# Altium schematic sheet Connections.SchDoc
size A; SheetNumber: 1; SheetTotal: 4
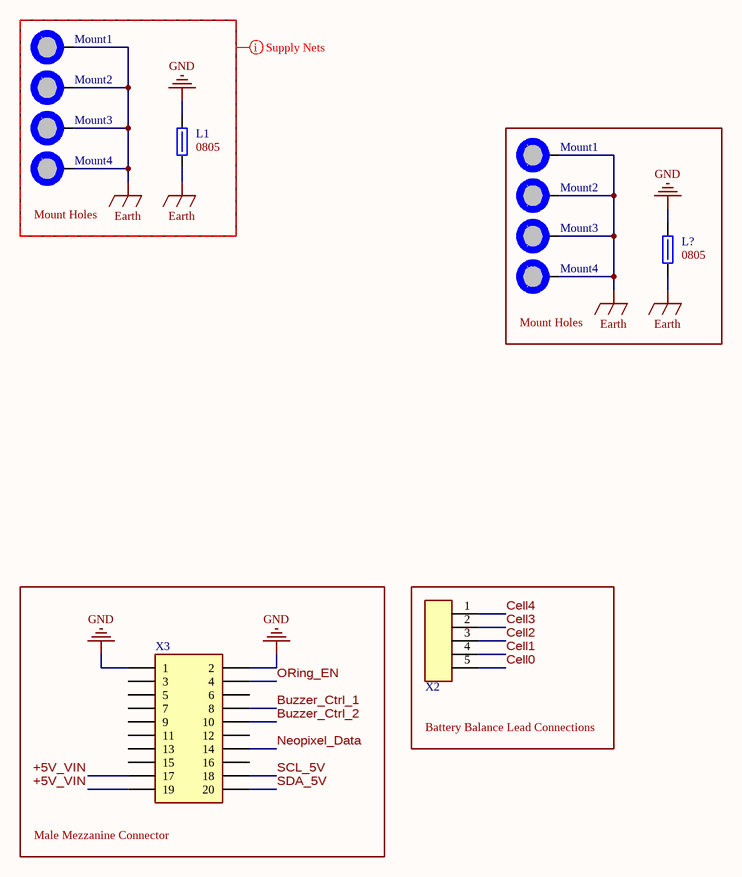
[diagram p0: Connections.SchDoc]

## Parts
(Parts that share a designator on the sheet are numbered #1, #2 ... from top to bottom, then left to right.)
L1  Size Package: 0805  [[Ferrite] SMD 0805]  (hidden comment: 652-MH2029-300Y)
L?  Size Package: 0805  [[Ferrite] SMD 0805]  (hidden comment: 652-MH2029-300Y)
Mount1#1  M3 Mount Hole  [[Mount] M3 Mount Hole]  (value not drawn)  (no BOM)
Mount1#2  M3 Mount Hole  [[Mount] M3 Mount Hole]  (value not drawn)  (no BOM)
Mount2#1  M3 Mount Hole  [[Mount] M3 Mount Hole]  (value not drawn)  (no BOM)
Mount2#2  M3 Mount Hole  [[Mount] M3 Mount Hole]  (value not drawn)  (no BOM)
Mount3#1  M3 Mount Hole  [[Mount] M3 Mount Hole]  (value not drawn)  (no BOM)
Mount3#2  M3 Mount Hole  [[Mount] M3 Mount Hole]  (value not drawn)  (no BOM)
Mount4#1  M3 Mount Hole  [[Mount] M3 Mount Hole]  (value not drawn)  (no BOM)
Mount4#2  M3 Mount Hole  [[Mount] M3 Mount Hole]  (value not drawn)  (no BOM)
X2  [JST] 5pin 90deg 2.54mm pitch  [[JST] 5pin 90deg 2.54mm pitch]  (value not drawn)
X3  [Mezzanine] 20pin H=3.5mm Male  [[Mezzanine] 20pin H=3.5mm Male]  (value not drawn)

## Blocks framed on the sheet
Mount Holes: L1 Mount1#1 Mount2#1 Mount3#1 Mount4#1
Mount Holes: L? Mount1#2 Mount2#2 Mount3#2 Mount4#2
Male Mezzanine Connector: X3
Battery Balance Lead Connections: X2

## Nets
Earth: L1.1 L?.1 Mount1#1.1 Mount1#2.1 Mount2#1.1 Mount2#2.1 Mount3#1.1 Mount3#2.1 Mount4#1.1 Mount4#2.1
GND: L1.2 L?.2 X3.1 X3.2
+5V_VIN: X3.17 X3.19
Buzzer_Ctrl_1: X3.8
Buzzer_Ctrl_2: X3.10
Cell0: X2.5
Cell1: X2.4
Cell2: X2.3
Cell3: X2.2
Cell4: X2.1
Neopixel_Data: X3.14
ORing_EN: X3.4
SCL_5V: X3.18
SDA_5V: X3.20

Not connected (* = marked no-connect by the designer): X3 3 5 6 7 9 11 12 13 15 16

## Layout directives
net class Supply_Nets: Earth, GND

## Library data of the parts
L1 L? = [Ferrite] SMD 0805 3A 30ohm: Res @ Freq: 30 @ 100MHz; Supplier 1: DigiKey; Supplier Part Number 1: MH2029-300YCT-ND
Mount1#1 Mount1#2 Mount2#1 Mount2#2 Mount3#1 Mount3#2 Mount4#1 Mount4#2 = [Mount] M3 Mount Hole: Place at least 4.5mm from board edge. Plated.
X3 = [Mezzanine] 20pin H=3.5mm Male: DF40HC(3.5)-20DS-0.4V(51); System: Connector; Supplier 1: DigiKey; Supplier Part Number 1: 26-DF40HC(3.5)-20DS-0.4V(51)CT-ND